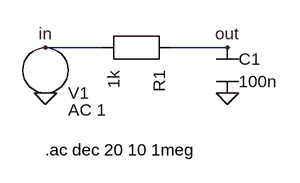
[diagram p0: schematic rc_lowpass_drawn.asc]
rc_lowpass_drawn.asc, the LTspice schematic file:
Version 4
SHEET 1 880 680
WIRE 96 96 176 96
WIRE 272 96 352 96
FLAG 96 96 in
FLAG 352 96 out
FLAG 96 160 0
FLAG 352 160 0
SYMBOL voltage 96 128 R0
SYMATTR InstName V1
SYMATTR Value AC 1
SYMBOL res 224 96 R90
SYMATTR InstName R1
SYMATTR Value 1k
SYMBOL cap 352 128 R0
SYMATTR InstName C1
SYMATTR Value 100n
TEXT 96 240 Left 2 !.ac dec 20 10 1meg

The netlist it stands for:
* rc_lowpass_drawn.asc
V1 in 0 AC 1
R1 out in 1k
C1 out 0 100n
.ac dec 20 10 1meg
.backanno
.end